# Altium project Gauge_ESP32-S31-WROOM-1.PrjPcb
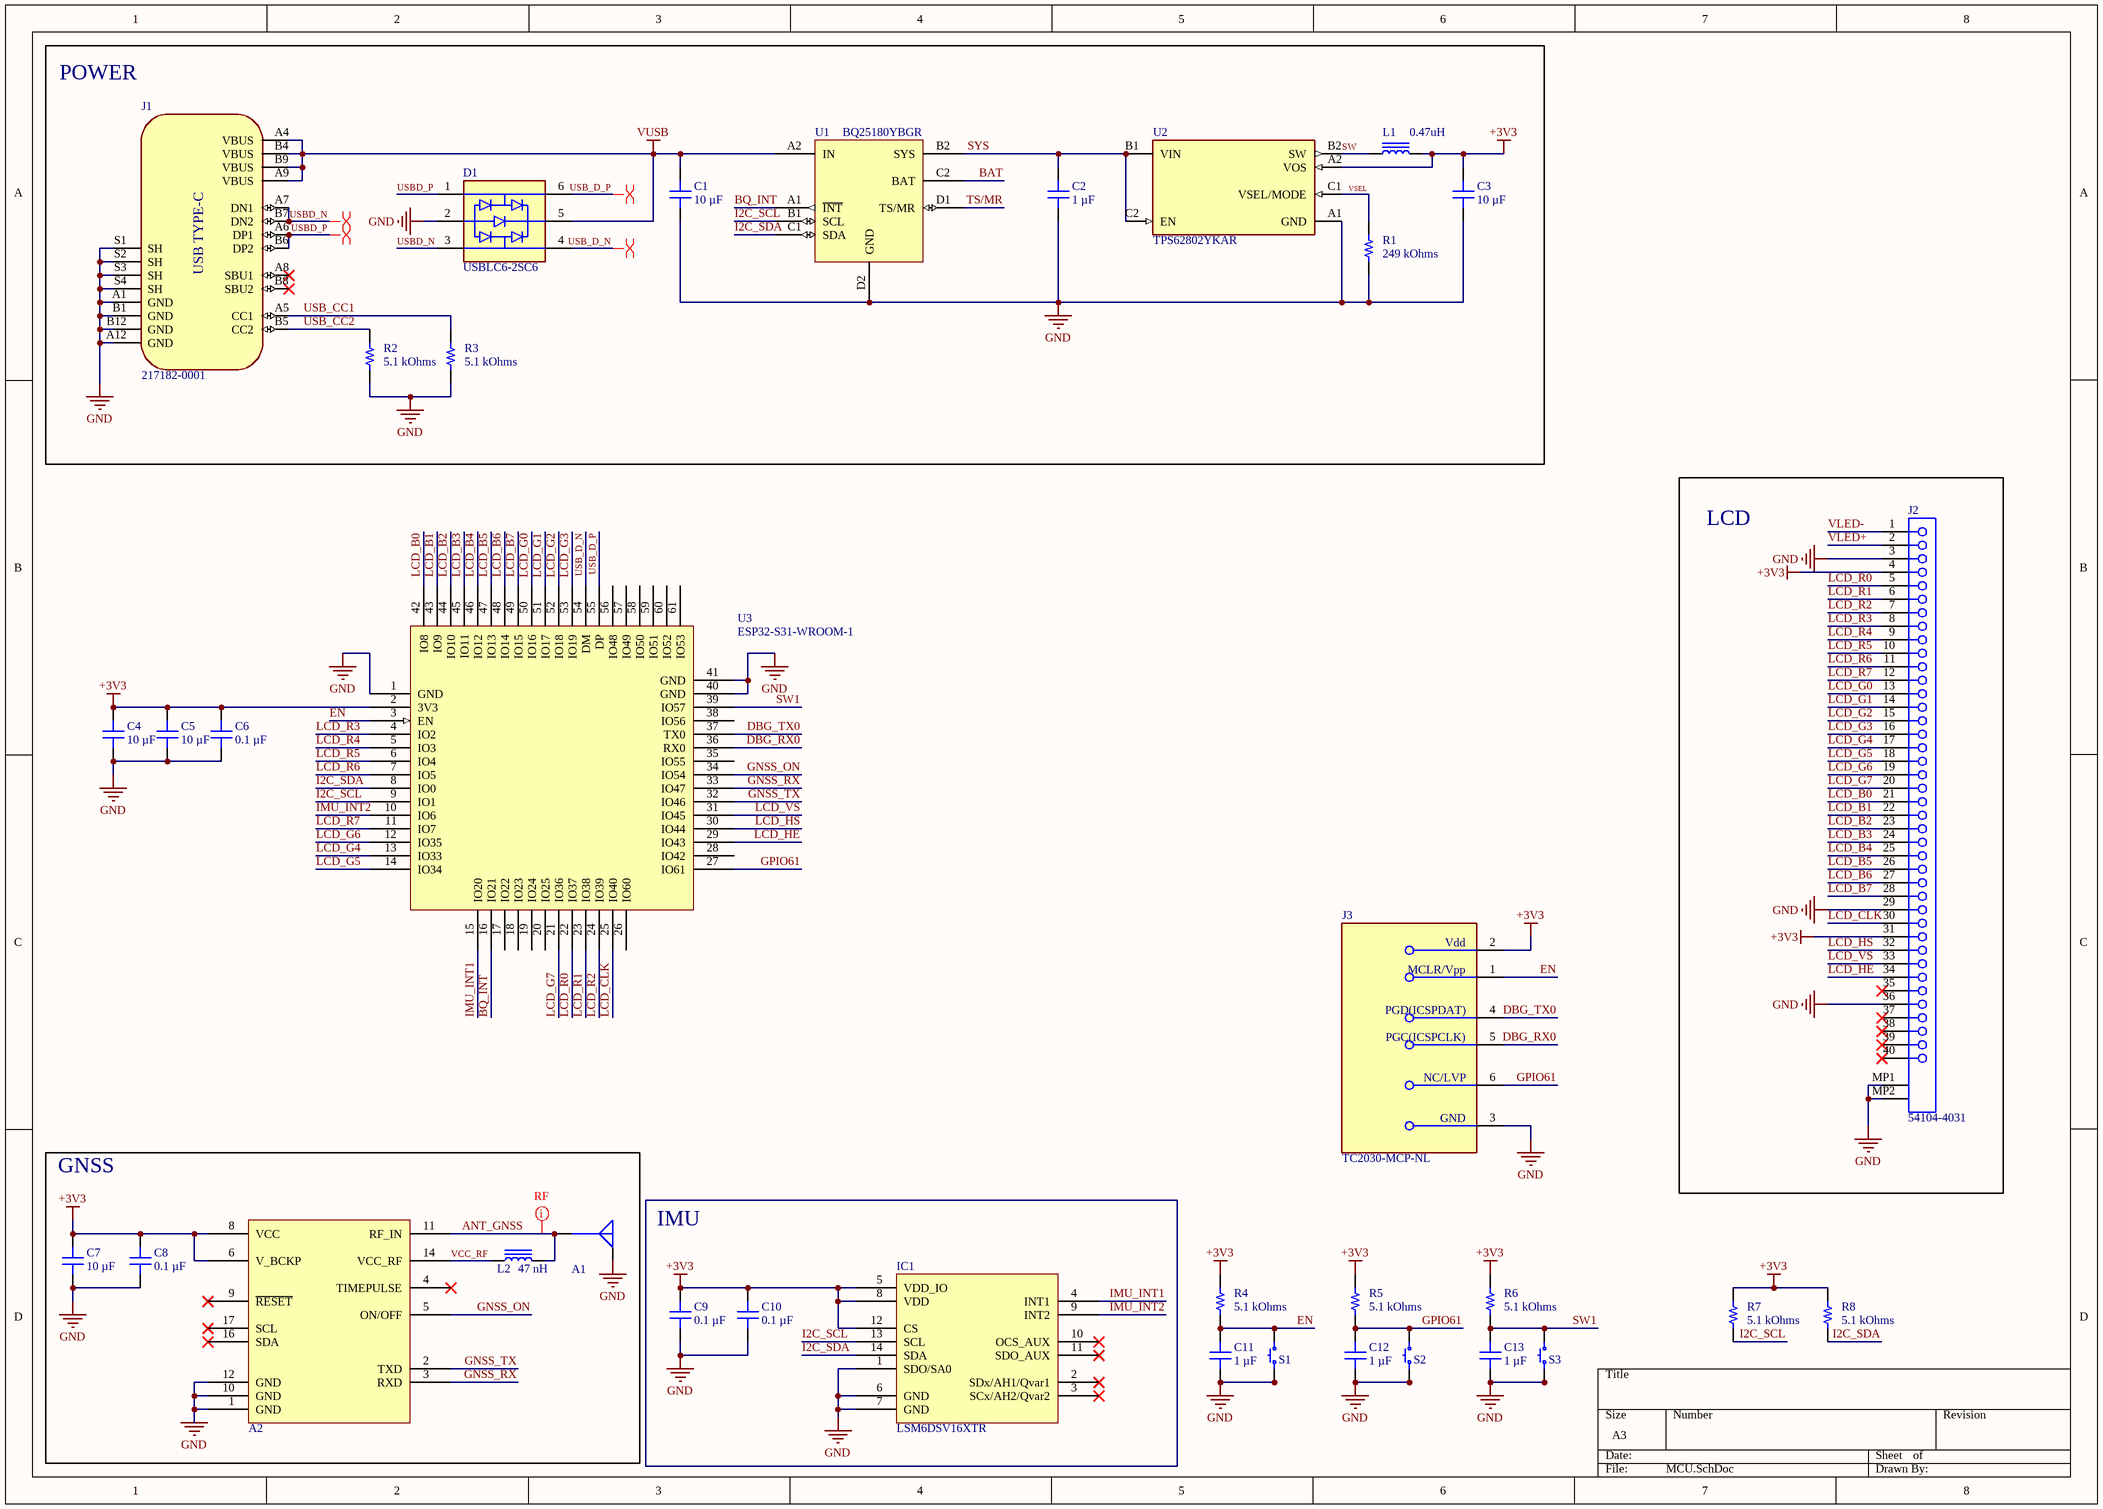
[diagram p0: MCU.SchDoc]
1 sheet, 36 parts. Net scope: global (net labels, ports and power ports of the same name join across sheets).
Board file: PCB1.PcbDoc

## Sheet MCU.SchDoc
size A3; SheetNumber: 1; SheetTotal: 1

### Parts
A1  1909763-1  [TE C-1909763]  (value not drawn)
A2  ATGM336H-5N  [U-BLOX MAX-8Q]  (value not drawn)
C1  10 µF  [CAP 0402_1005]
C2  1 µF  [CAP 0201_0603]
C3  10 µF  [CAP 0402_1005]
C4  10 µF  [CAP 0402_1005]
C5  10 µF  [CAP 0402_1005]
C6  0.1 µF  [CAP 0201_0603]
C7  10 µF  [CAP 0402_1005]
C8  0.1 µF  [CAP 0201_0603]
C9  0.1 µF  [CAP 0201_0603]
C10  0.1 µF  [CAP 0201_0603]
C11  1 µF  [CAP 0201_0603]
C12  1 µF  [CAP 0201_0603]
C13  1 µF  [CAP 0201_0603]
D1  USBLC6-2SC6  [STM-SOT23-6L_V]
IC1  LSM6DSV16XTR  [STM LGA-14L 2.5x3.0MM]
J1  217182-0001  [FP-217182-0001-MFG]
J2  54104-4031  [MOLX-54104-4031]
J3  TC2030-MCP-NL  [FP-TC2030-MCP-NL-MFG]
L1  0.47uH  [INDC1608X95N]
L2  47 nH  [IND 0402_1005 RF WW]
R1  249 kOhms  [RES 0201_0603]
R2  5.1 kOhms  [RES 0201_0603]
R3  5.1 kOhms  [RES 0201_0603]
R4  5.1 kOhms  [RES 0201_0603]
R5  5.1 kOhms  [RES 0201_0603]
R6  5.1 kOhms  [RES 0201_0603]
R7  5.1 kOhms  [RES 0201_0603]
R8  5.1 kOhms  [RES 0201_0603]
S1  PTS810 SJM 250 SMTR LFS  [C&K PTS810]  (value not drawn)
S2  PTS810 SJM 250 SMTR LFS  [C&K PTS810]  (value not drawn)
S3  PTS810 SJM 250 SMTR LFS  [C&K PTS810]  (value not drawn)
U1  BQ25180YBGR  [BGA8C40P2X4_104X159X50M]
U2  TPS62802YKAR  [FP-YKA0006-IPC_B]
U3  ESP32-S31-WROOM-1  [ESP32-S31-WROOM-1]

### Blocks framed on the sheet
POWER: C1-C3 D1 J1 L1 R1-R3 U1 U2
LCD: J2
GNSS: A1 A2 C7 C8 L2
IMU: C9 C10 IC1

### Nets
+3V3: A2.6(V_BCKP) A2.8(VCC) C3.2 C4.2 C5.2 C6.2 C7.2 C8.2 C9.2 C10.2 IC1.5(VDD_IO) IC1.8(VDD) IC1.12(CS) J2.4 J2.31 J3.2(Vdd) L1.2 R4.2 R5.2 R6.2 R7.2 R8.2 U2.A2(VOS) U3.2(3V3)
GND: A1.G A2.1(GND) A2.10(GND) A2.12(GND) C1.1 C2.1 C3.1 C4.1 C5.1 C6.1 C7.1 C8.1 C9.1 C10.1 C11.1 C12.1 C13.1 D1.2(GND) IC1.1(SDO/SA0) IC1.6(GND) IC1.7(GND) J1.A1(GND) J1.A12(GND) J1.B1(GND) J1.B12(GND) J1.S1(SH) J1.S2(SH) J1.S3(SH) J1.S4(SH) J2.3 J2.29 J2.36 J2.MP1 J2.MP2 J3.3(GND) R1.1 R2.1 R3.1 S1.1 S1.2 S2.1 S2.2 S3.1 S3.2 U1.D2(GND) U2.A1(GND) U3.1(GND) U3.40(GND) U3.41(GND)
VUSB: C1.2 D1.5(VBUS) J1.A4(VBUS) J1.A9(VBUS) J1.B4(VBUS) J1.B9(VBUS) U1.A2(IN)
ANT_GNSS: A1.S A2.11(RF_IN) L2.2
BAT: U1.C2(BAT)
BQ_INT: U1.A1(~{INT}) U3.16(IO21)
DBG_RX0: J3.5(PGC(ICSPCLK)) U3.36(RX0)
DBG_TX0: J3.4(PGD(ICSPDAT)) U3.37(TX0)
EN: C11.2 J3.1(MCLR/Vpp) R4.1 S1.3 S1.4 U3.3(EN)
GNSS_ON: A2.5(ON/OFF) U3.34(IO54)
GNSS_RX: A2.3(RXD) U3.33(IO47)
GNSS_TX: A2.2(TXD) U3.32(IO46)
GPIO61: C12.2 J3.6(NC/LVP) R5.1 S2.3 S2.4 U3.27(IO61)
I2C_SCL: IC1.13(SCL) R7.1 U1.B1(SCL) U3.9(IO1)
I2C_SDA: IC1.14(SDA) R8.1 U1.C1(SDA) U3.8(IO0)
IMU_INT1: IC1.4(INT1) U3.15(IO20)
IMU_INT2: IC1.9(INT2) U3.10(IO6)
LCD_B0: J2.21 U3.42(IO8)
LCD_B1: J2.22 U3.43(IO9)
LCD_B2: J2.23 U3.44(IO10)
LCD_B3: J2.24 U3.45(IO11)
LCD_B4: J2.25 U3.46(IO12)
LCD_B5: J2.26 U3.47(IO13)
LCD_B6: J2.27 U3.48(IO14)
LCD_B7: J2.28 U3.49(IO15)
LCD_CLK: J2.30 U3.25(IO40)
LCD_G0: J2.13 U3.50(IO16)
LCD_G1: J2.14 U3.51(IO17)
LCD_G2: J2.15 U3.52(IO18)
LCD_G3: J2.16 U3.53(IO19)
LCD_G4: J2.17 U3.13(IO33)
LCD_G5: J2.18 U3.14(IO34)
LCD_G6: J2.19 U3.12(IO35)
LCD_G7: J2.20 U3.21(IO36)
LCD_HE: J2.34 U3.29(IO43)
LCD_HS: J2.32 U3.30(IO44)
LCD_R0: J2.5 U3.22(IO37)
LCD_R1: J2.6 U3.23(IO38)
LCD_R2: J2.7 U3.24(IO39)
LCD_R3: J2.8 U3.4(IO2)
LCD_R4: J2.9 U3.5(IO3)
LCD_R5: J2.10 U3.6(IO4)
LCD_R6: J2.11 U3.7(IO5)
LCD_R7: J2.12 U3.11(IO7)
LCD_VS: J2.33 U3.31(IO45)
SW: L1.1 U2.B2(SW)
SW1: C13.2 R6.1 S3.3 S3.4 U3.39(IO57)
SYS: C2.2 U1.B2(SYS) U2.B1(VIN) U2.C2(EN)
TS/MR: U1.D1(TS/MR)
USB_CC1: J1.A5(CC1) R3.2
USB_CC2: J1.B5(CC2) R2.2
USB_D_N: D1.4(I/O3) U3.54(DM)
USB_D_P: D1.6(I/O4) U3.55(DP)
USBD_N: D1.3(I/O2) J1.A7(DN1) J1.B7(DN2)
USBD_P: D1.1(I/O1) J1.A6(DP1) J1.B6(DP2)
VCC_RF: A2.14(VCC_RF) L2.1
VLED+: J2.2
VLED-: J2.1
VSEL: R1.2 U2.C1(VSEL/MODE)

Not connected (* = marked no-connect by the designer): A2 4(TIMEPULSE)* 9(~{RESET})* 16(SDA)* 17(SCL)*; IC1 2(SDx/AH1/Qvar1)* 3(SCx/AH2/Qvar2)* 10(OCS_AUX)* 11(SDO_AUX)*; J1 A8(SBU1)* B8(SBU2)*; J2 35* 37* 38* 39* 40*; U3 17(IO22) 18(IO23) 19(IO24) 20(IO25) 26(IO60) 28(IO42) 35(IO55) 38(IO56) 56(IO48) 57(IO49) 58(IO50) 59(IO51) 60(IO52) 61(IO53)

### Layout directives
differential pair: USB_D_N, USB_D_P, USBD_N, USBD_P
net class RF: ANT_GNSS

### Notes on the sheet
- (in symbol 217182-0001) USB TYPE-C

### Library data of the parts
A1 = 1909763-1: CONN UMCC JACK STR 50OHM SMD; Manufacturer: TE Connectivity AMP Connectors; id: 12; Contact Termination: Solder; Connector Type: Jack, Male Pin; Number Of Ports: 1; Connector Style: U.FL (UMCC); Frequency - Max: 6 GHz; Part Number: 1909763-1; Housing Color: Ivory; Supplier Part Number 1: A118077CT-ND; ComponentLink1Description: Datasheet; ComponentLink2URL: https://www.digikey.com/en/products/detail/te-connectivity-amp-connectors/1909763-1/4731728; ComponentLink1URL: https://www.te.com/commerce/DocumentDelivery/DDEController?Action=srchrtrv&DocNm=1909763&DocType=Customer+Drawing&DocLang=English; Fastening Type: Snap-On; Supplier 1: DigiKey; Series: -; Part Status: Active; Shield Termination: Solder; ComponentLink2Description: DigiKey Link; Packaging: TapeAndReel; Minimum Order: 1; Lifecycle Status: Active; LastUpdated: 2022-06-29T18:17:07.053; Mounting Type: Surface Mount; Impedance: 50Ohm; Price: 0.23
A2 = ATGM336H-5N: RF RX GLONASS/GNSS/GPS 1.575GHZ; id: 1; Voltage - Supply: 2.7V ~ 3.6V; Data Interface: I²C, UART; Part Number: ATGM336H-5N; ComponentLink1Description: Datasheet; ComponentLink1URL: https://github.com/YahboomTechnology/GPS_Module/blob/main/1.GPS%20module%20information/ATGM336H-5N%20Datasheet_EN.pdf; Series: ATGM336H-5N
C1 C3-C5 C7 = CL05A106MP5NUNC: CAP CER 10UF 10V X5R 0402; Manufacturer: Samsung Electro-Mechanics; id: 35; Tolerance: ±20%; Part Number: CL05A106MP5NUNC; Value: 10 µF; Temperature Coefficient: X5R; Supplier Part Number 1: 1276-1450-1-ND; ComponentLink2Description: DigiKey Link; ComponentLink1URL: http://www.samsungsem.com/kr/support/product-search/mlcc/CL05A106MP5NUNC.jsp; PartId: 1762; Supplier 1: DigiKey; Series: CL; LastUpdated: 2023-01-03T20:04:20.307; Part Status: Active; Capacitance: 10 µF; Device Package: 0402 (1005 Metric); Thickness (Max): 0.028" (0.70mm); Voltage - Rated: 10V; Minimum Order: 1; Packaging: TapeAndReel; Applications: General Purpose; Package / Case: 0402 (1005 Metric); ComponentLink1Description: Datasheet; Price: 0.02; ComponentLink2URL: https://www.digikey.com/en/products/detail/samsung-electro-mechanics/CL05A106MP5NUNC/3887108; Lifecycle Status: Active; Operating Temperature: -55°C ~ 85°C; Size / Dimension: 0.039" L x 0.020" W (1.00mm x 0.50mm); Mounting Type: Surface Mount, MLCC
C2 C11-C13 = CL03A105MP3NSNC: CAP CER 1UF 10V X5R 0201; Manufacturer: Samsung Electro-Mechanics; id: 1118; Tolerance: ±20%; Part Number: CL03A105MP3NSNC; Value: 1 µF; Temperature Coefficient: X5R; Supplier Part Number 1: 1276-1324-1-ND; ComponentLink2Description: DigiKey Link; ComponentLink1URL: http://www.samsungsem.com/kr/support/product-search/mlcc/CL03A105MP3NSNC.jsp; PartId: 1341; Supplier 1: DigiKey; Series: CL; LastUpdated: 2023-01-03T20:01:05.547; Part Status: Active; Capacitance: 1 µF; Device Package: 0201 (0603 Metric); Thickness (Max): 0.013" (0.33mm); Voltage - Rated: 10V; Minimum Order: 1; Packaging: TapeAndReel; Applications: General Purpose; Package / Case: 0201 (0603 Metric); ComponentLink1Description: Datasheet; Price: 0.05; ComponentLink2URL: https://www.digikey.com/en/products/detail/samsung-electro-mechanics/CL03A105MP3NSNC/3886982; Lifecycle Status: Active; Operating Temperature: -55°C ~ 85°C; Size / Dimension: 0.024" L x 0.012" W (0.60mm x 0.30mm); Mounting Type: Surface Mount, MLCC
C6 C8-C10 = CL03A104KO3NNNC: CAP CER 0.1UF 16V X5R 0201; Manufacturer: Samsung Electro-Mechanics; id: 937; Tolerance: ±10%; Part Number: CL03A104KO3NNNC; Value: 0.1 µF; Temperature Coefficient: X5R; Supplier Part Number 1: 1276-1319-1-ND; ComponentLink2Description: DigiKey Link; ComponentLink1URL: http://www.samsungsem.com/kr/support/product-search/mlcc/CL03A104KO3NNNC.jsp; PartId: 1101; Supplier 1: DigiKey; Series: CL; LastUpdated: 2023-01-03T20:01:08.207; Part Status: Active; Capacitance: 0.1 µF; Device Package: 0201 (0603 Metric); Thickness (Max): 0.013" (0.33mm); Voltage - Rated: 16V; Minimum Order: 1; Packaging: TapeAndReel; Applications: General Purpose; Package / Case: 0201 (0603 Metric); ComponentLink1Description: Datasheet; Price: 0.01; ComponentLink2URL: https://www.digikey.com/en/products/detail/samsung-electro-mechanics/CL03A104KO3NNNC/3886977; Lifecycle Status: Active; Operating Temperature: -55°C ~ 85°C; Size / Dimension: 0.024" L x 0.012" W (0.60mm x 0.30mm); Mounting Type: Surface Mount, MLCC
D1 = USBLC6-2SC6: STMicroelectronics Uni-directional TVS Diode Array, Vc=17V, SMD, SOT-23, Vbr(min)=6V; Breakdown Voltage: 6V; Value: 2.5pF; Clamping Voltage: 17V; Data Rate: 480Mbps; Direction: Unidirectional; Element Configuration: Dual; ESD Protection: Yes; Forward Voltage: 1.1V; Leakage Current: 150nA; Max Junction Temperature (Tj): 125°C; Max Repetitive Reverse Voltage (Vrrm): 5.25V; Number of Bidirectional Channels: 2; Number of Elements: 1; Peak Pulse Current: 5A; Peak Pulse Power: 85W; Reverse Standoff Voltage: 5V; Test Current: 1mA; Supplier: Future Electronics; Supplier Part Number: USBLC6-2SC6; Manufacturer: STMicroelectronics; Manufacturer Part Number: USBLC6-2SC6; RoHS: Compliant; Category: TVS Diodes; Stock: 135000; Pricing: 3000=0,0806, 6000=0,0793, 12000=0,078, 15000=0,0776, 45000=0,075 (USD); Case/Package: SOT-23; China RoHS: Compliant; Contact Plating: Tin; Country of Origin: Mainland China; Depth: 1.75mm; Export Control Classification Number (ECCN) Code: EAR99; Height: 1.45mm; Harmonized Tariff Schedule (HTS) Code: 8541.10.00.50; Introduction Date: 2005-03-15; Lead Free: Lead Free; Length: 3.05mm; Lifecycle Status: Production; Max Breakdown Voltage: 6V; Max Operating Temperature: 125°C; Max Reverse Leakage Current: 150nA; Min Breakdown Voltage: 6V; Min Operating Temperature: -40°C; Mounting Technology: Surface Mount; Number of Channels: 2; Pins: 6; Number of Terminals: 6; Operating Supply Voltage: 1.1V; Peak Reverse Current: 150nA; Polarity: Unidirectional; Power Line Protection: Yes; Radiation Hardening: No; REACH SVHC: Unaffected; Reverse Breakdown Voltage: 6V; Schedule B: 8536300000, 8536300000|8536300000|8536300000|8536300000|8536300000|8536300000|8536300000|8536300000|8536300000|8536300000|8536300000|8536300000|8536300000|8536300000|8536300000|8536300000|8536300000|8536300000|8536300000|8536300000|8536300000|8536300000|8536300000|85; Termination: SMD/SMT; Width: 1.75mm; Working Voltage: 5V; ComponentLink1URL: https://datasheet.octopart.com:443/USBLC6-2SC6-STMicroelectronics-datasheet-10412581.pdf?src-supplier=Newark; ComponentLink1Description: https://datasheet.octopart.com:443/USBLC6-2SC6-STMicroelectronics-datasheet-10412581.pdf?src-supplier=Newark; ComponentLink2URL: https://datasheet.octopart.com:443/USBLC6-2SC6-STMicroelectronics-datasheet-181961833.pdf?src-supplier=Newark; ComponentLink2Description: https://datasheet.octopart.com:443/USBLC6-2SC6-STMicroelectronics-datasheet-181961833.pdf?src-supplier=Newark; ComponentLink3URL: https://datasheet.octopart.com:443/USBLC6-2SC6-STMicroelectronics-datasheet-525477.pdf?src-supplier=Factory+Futures; ComponentLink3Description: https://datasheet.octopart.com:443/USBLC6-2SC6-STMicroelectronics-datasheet-525477.pdf?src-supplier=Factory+Futures; ComponentLink4URL: https://datasheet.octopart.com:443/USBLC6-2SC6-STMicroelectronics-datasheet-82998616.pdf?src-supplier=Farnell; ComponentLink4Description: https://datasheet.octopart.com:443/USBLC6-2SC6-STMicroelectronics-datasheet-82998616.pdf?src-supplier=Farnell; ComponentLink5URL: https://datasheet.octopart.com:443/USBLC6-2SC6-STMicroelectronics-datasheet-46285.pdf?src-supplier=Farnell; ComponentLink5Description: https://datasheet.octopart.com:443/USBLC6-2SC6-STMicroelectronics-datasheet-46285.pdf?src-supplier=Farnell; ComponentLink6URL: https://datasheet.octopart.com:443/USBLC6-2SC6-STMicroelectronics-datasheet-14050643.pdf?src-supplier=iiiC; ComponentLink6Description: https://datasheet.octopart.com:443/USBLC6-2SC6-STMicroelectronics-datasheet-14050643.pdf?src-supplier=iiiC; ComponentLink7URL: https://datasheet.octopart.com:443/USBLC6-2SC6-STMicroelectronics-datasheet-10521292.pdf?src-supplier=Jameco+(USA); ComponentLink7Description: https://datasheet.octopart.com:443/USBLC6-2SC6-STMicroelectronics-datasheet-10521292.pdf?src-supplier=Jameco+(USA)
IC1 = STM LSM6DSV16X: INEMO 3D ACCELEROMETER AND 3D GY; Manufacturer: STMicroelectronics; id: 1; Output Type: I2C, SPI; Sensor Type: Accelerometer, Gyroscope, Temperature, 6 Axis; Part Number: LSM6DSV16XTR; ComponentLink2URL: https://www.digikey.com/en/products/detail/stmicroelectronics/LSM6DSV16XTR/16841485; Price: 2.76; Supplier 1: DigiKey; ComponentLink1Description: Datasheet; ComponentLink2Description: DigiKey Link; Minimum Order: 1; Supplier Part Number 1: 497-LSM6DSV16XTRCT-ND; Operating Temperature: -40°C ~ 85°C; Mounting Type: Surface Mount; Supplier Device Package: 14-LGA (2.5x3); ComponentLink1URL: https://www.st.com/content/ccc/resource/technical/document/datasheet/group3/47/03/b2/44/47/32/4b/76/DM00741844/files/DM00741844.pdf/jcr:content/translations/en.DM00741844.pdf; Packaging: TapeAndReel; Series: -; LastUpdated: 2026-02-04T10:16:47.433; Lifecycle Status: Active
J1 = 217182-0001: USB Connector, Receptacle, USB 2.0, USB Type C, 16 Ways, Gold, SMT, Straight, Copper Alloy; MF: HRO Electronics Co., Ltd.; MP: TYPE-C-31-M-12; SnapEDA_Link: https://www.snapeda.com/parts/TYPE-C-31-M-12/HRO+Electronics+Co.%252C+Ltd./view-part/?ref=snap; Package: Package; Value: *; Check_prices: https://www.snapeda.com/parts/TYPE-C-31-M-12/HRO+Electronics+Co.%252C+Ltd./view-part/?ref=eda
J2 = CMP-1241-00508-1: 0.5 mm Pitch Easy-On(TM) Type FPC Connector, 2.0 mm Mated Height, Right Angle, ZIF, SMT, Top Contact, 40 Circuits, -20 to 85 degC, ELV and RoHS Compliant, Tape and Reel; Manufacturer: Molex; PCB Retention: Yes; Current (Max per Contact): 0.5A; Stackable: No; Durability (mating cycles max): 20; Pitch - Mating Interface: 0.50mm; Circuits (Loaded): 40; Mated Height: 2.00mm; Entry Angle: 90degrees Angle; Material - Metal: Phosphor Bronze; Voltage (Max): 50V; ComponentLink3URL: http://www.molex.com/pdm_docs/sd/541044031_sd.pdf; ComponentLink2URL: http://www.molex.com/webdocs/datasheets/pdf/en-us/0541044031_FFC_FPC_CONNECTORS.pdf; Number of Rows: 1; ComponentLink1Description: Manufacturer URL; ComponentLink2Description: Datasheet; Mounting Technology: Surface Mount; ComponentLink1URL: http://www.molex.com/molex/index.jsp; RoHS: TRUE; PackageReference: 54104-4031; Polarized to PCB: Yes; ComponentLink3Description: Package Specification; PackageVersion: Rev. F, 06/2012; PackageDescription: 40-Lead FPC Connector, Pitch 0.5 mm; Contact Position: Top; PCB Locator: No; PartNumber: 54104-4031; Orientation: Right Angle; Packing: Tape and Reel
J3 = CMP-205963-000002-1: CABLE TAG-CONNECT IN-CIRCUIT; RoHS Compliant: Yes; Series: -; Reach SVHC Compliant: Yes; Package Quantity: 1; Lead Free: Lead Free
L1 = LQM18PNR47MFHD: Inductor Power Chip Shielded Multi-Layer 0.47uH 20% 1MHz Ferrite 1.4A 0.125Ohm DCR 0603 T/R; Value: 0.47uH
L2 = LQW15AN47NJ00D: FIXED IND 47NH 210MA 1.08OHM SMD; Manufacturer: Murata Electronics; id: 266; Frequency - Self Resonant: 2.9GHz; Tolerance: ±5%; Type: Wirewound; Inductance Frequency - Test: 100 MHz; Q @ Freq: 25 @ 200MHz; Material - Core: Non-Magnetic; DC Resistance (DCR): 1.08Ohm Max; Shielding: Unshielded; Part Number: LQW15AN47NJ00D; Height - Seated (Max): 0.024" (0.60mm); Supplier Part Number 1: 490-1154-1-ND; Current Rating (Amps): 210 mA; Inductance: 47 nH; ComponentLink1Description: Datasheet; ComponentLink2URL: https://www.digikey.com/en/products/detail/murata-electronics/LQW15AN47NJ00D/584363; ComponentLink1URL: https://search.murata.co.jp/Ceramy/image/img/P02/JELF243A-0050.pdf; Supplier 1: DigiKey; Series: LQW15; Part Status: Active; ComponentLink2Description: DigiKey Link; Device Package: 0402 (1005 Metric); Packaging: TapeAndReel; Minimum Order: 1; Package / Case: 0402 (1005 Metric); PartId: 266; Lifecycle Status: Active; LastUpdated: 2023-01-02T20:59:31.513; Operating Temperature: -55°C ~ 125°C; Value: 47 nH; Size / Dimension: 0.039" L x 0.020" W (1.00mm x 0.50mm); Mounting Type: Surface Mount; Price: 0.05
R1 = RC0201FR-07249KL: RES 249K OHM 1% 1/20W 0201; Manufacturer: Yageo; id: 1449; Temperature Coefficient: ±200ppm/°C; Power (Watts): 0.05W, 1/20W; Part Number: RC0201FR-07249KL; Height - Seated (Max): 0.010" (0.26mm); Supplier Part Number 1: YAG2335CT-ND; Supplier Device Package: 0201; ComponentLink1Description: Datasheet; ComponentLink2URL: https://www.digikey.com/en/products/detail/yageo/RC0201FR-07249KL/3202395; Features: Moisture Resistant; ComponentLink1URL: https://www.yageo.com/upload/media/product/productsearch/datasheet/rchip/PYu-RC_Group_51_RoHS_L_10.pdf; Composition: Thick Film; Tolerance: ±1%; Supplier 1: DigiKey; Series: RC_L; Part Status: Active; ComponentLink2Description: DigiKey Link; Device Package: 0201 (0603 Metric); Packaging: CutTape; Minimum Order: 1; Package / Case: 0201 (0603 Metric); PartId: 1449; Lifecycle Status: Active; LastUpdated: 2023-01-03T20:15:18.457; Operating Temperature: -55°C ~ 125°C; Number Of Terminations: 2; Value: 249 kOhms; Size / Dimension: 0.024" L x 0.012" W (0.60mm x 0.30mm); Price: 0.01; Resistance: 249 kOhms
R2-R8 = AC0201FR-075K1L: RES SMD 5.1K OHM 1% 1/20W 0201; Manufacturer: Yageo; id: 225; Temperature Coefficient: ±200ppm/°C; Power (Watts): 0.05W, 1/20W; Part Number: AC0201FR-075K1L; Height - Seated (Max): 0.010" (0.26mm); Supplier Part Number 1: YAG5228CT-ND; Supplier Device Package: 0201; ComponentLink1Description: Datasheet; ComponentLink2URL: https://www.digikey.com/en/products/detail/yageo/AC0201FR-075K1L/5894738; Features: Automotive AEC-Q200, Moisture Resistant; ComponentLink1URL: https://www.yageo.com/upload/media/product/productsearch/datasheet/rchip/PYu-AC_51_RoHS_L_7.pdf; Composition: Thick Film; Tolerance: ±1%; Supplier 1: DigiKey; Series: AC; Part Status: Active; ComponentLink2Description: DigiKey Link; Device Package: 0201 (0603 Metric); Packaging: TapeAndReel; Ratings: AEC-Q200; Minimum Order: 1; Package / Case: 0201 (0603 Metric); PartId: 225; Lifecycle Status: Active; LastUpdated: 2023-01-03T20:15:25.347; Operating Temperature: -55°C ~ 155°C; Number Of Terminations: 2; Value: 5.1 kOhms; Size / Dimension: 0.024" L x 0.012" W (0.60mm x 0.30mm); Price: 0.01; Resistance: 5.1 kOhms
S1-S3 = PTS810 SJM 250 SMTR LFS: SWITCH TACTILE SPST-NO 0.05A 16V; Manufacturer: C&K; id: 32; Switch Function: Off-Mom; Contact Rating @ Voltage: 0.05A @ 16VDC; Outline: 4.20mm x 3.20mm; Actuator Height Off Pcb, Vertical: 2.50mm; Actuator Orientation: Top Actuated; Actuator Type: Oval Button; Illumination: Non-Illuminated; Operating Force: 160gf; Part Number: PTS810 SJM 250 SMTR LFS; Supplier Part Number 1: CKN10502CT-ND; ComponentLink1Description: Datasheet; ComponentLink2URL: http://digikey.com/product-detail/en/c-k/PTS810-SJM-250-SMTR-LFS/CKN10502CT-ND/4176673; ComponentLink1URL: https://dznh3ojzb2azq.cloudfront.net/products/Tactile/PTS810/documents/datasheet.pdf; Supplier 1: DigiKey; Series: PTS810; Part Status: Active; ComponentLink2Description: DigiKey Link; Packaging: TapeAndReel; Minimum Order: 1; Lifecycle Status: Active; LastUpdated: 2020-04-09T10:00:13.177; Termination Style: J Lead; Operating Temperature: -40°C ~ 85°C; Circuit: SPST-NO; Mounting Type: Surface Mount; Price: 0.16
U1 = BQ25180YBGR: 1-A Li-ion and LiFePO4 I²C programmable linear charger with regulated power path
U2 = CMP-04918-000016-1: IC REG BUCK ADJ/FIX 1A 6DSBGA; Manufacturer: Texas Instruments; Switching Frequency: 4MHz; Output Type: AdjustableProgrammable; Max Supply Voltage: 5.5V; Max Duty Cycle: 100%; Nominal Supply Current: 8mA; Min Supply Voltage: 1.8V; Output Voltage: 1.8-3.3V; Max Junction Temp: +125°C; Number Of Outputs: 1; Standoff Height: 0.13mm; Device Class L1: Integrated Circuits (ICs); Octopart: https://octopart.com/tps62802ykar-texas+instruments-93944571; ComponentLink2Description: Datasheet; Package: YKA0006; Mouser Description: 1.8V-5.5V input, 1-A ultra-low Iq step-down converter 6-DSBGA -40 to 125; Switching Topology: Buck; Output Current: 1A; Automotive: No; Temperature Range High: +125°C; Device Class L3: Voltage Regulators - Switching; Temperature Range Low: -40°C; Device Class L2: Power Management ICs; Digikey Description: IC REG BUCK ADJ/FIX 1A 6DSBGA; Lead Free: Yes; Category: IC; ComponentLink2URL: http://www.ti.com/lit/ds/symlink/tps62802.pdf; Manufacturer Part Number: TPS62802YKAR; Temperature: -40°C to +125°C; Ipc Land Pattern Name: BGA6N35P2X3_105X70X40; RoHS: TRUE; Height: 0.4mm